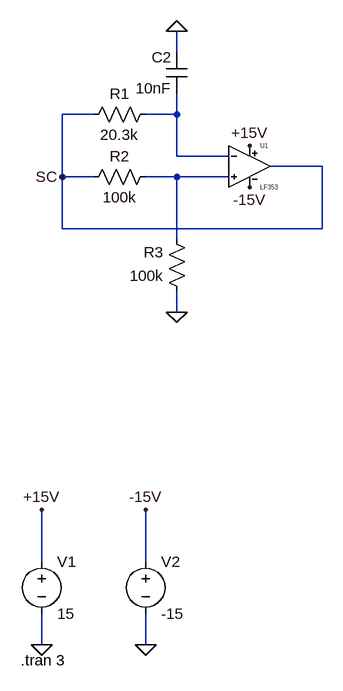
[diagram p0: schematic Draft1.asc]
Draft1.asc, the LTspice schematic file:
Version 4.1
SHEET 1 880 680
WIRE -64 -288 -64 -320
WIRE -192 -192 -240 -192
WIRE -64 -192 -64 -224
WIRE -64 -192 -112 -192
WIRE -64 -128 -64 -192
WIRE 16 -128 -64 -128
WIRE 160 -112 80 -112
WIRE -240 -96 -240 -192
WIRE -192 -96 -240 -96
WIRE -64 -96 -112 -96
WIRE 16 -96 -64 -96
WIRE -240 -16 -240 -96
WIRE 160 -16 160 -112
WIRE 160 -16 -240 -16
WIRE -64 0 -64 -96
WIRE -64 112 -64 80
WIRE -272 496 -272 416
WIRE -112 496 -112 416
WIRE -272 624 -272 576
WIRE -112 624 -112 576
FLAG -272 624 0
FLAG -112 624 0
FLAG -272 416 +15V
FLAG -112 416 -15V
FLAG 48 -144 +15V
FLAG 48 -80 -15V
FLAG -64 -320 0
FLAG -64 112 0
FLAG -240 -96 SC
SYMBOL voltage -272 480 R0
WINDOW 123 0 0 Left 0
WINDOW 39 0 0 Left 0
SYMATTR InstName V1
SYMATTR Value 15
SYMBOL voltage -112 480 R0
WINDOW 123 0 0 Left 0
WINDOW 39 0 0 Left 0
SYMATTR InstName V2
SYMATTR Value -15
SYMBOL UserLibs\\LTwiki\\lf353_ns 48 -176 R0
SYMATTR InstName U1
SYMBOL res -208 -176 R270
WINDOW 0 32 56 VTop 2
WINDOW 3 0 56 VBottom 2
SYMATTR InstName R1
SYMATTR Value 20.3k
SYMBOL res -96 -112 R90
WINDOW 0 0 56 VBottom 2
WINDOW 3 32 56 VTop 2
SYMATTR InstName R2
SYMATTR Value 100k
SYMBOL res -48 96 R180
WINDOW 0 36 76 Left 2
WINDOW 3 36 40 Left 2
SYMATTR InstName R3
SYMATTR Value 100k
SYMBOL cap -48 -224 R180
WINDOW 0 24 56 Left 2
WINDOW 3 24 8 Left 2
SYMATTR InstName C2
SYMATTR Value 10nF
TEXT -304 648 Left 2 !.tran 3

The netlist it stands for:
* Draft1.asc
V1 +15V 0 15
V2 -15V 0 -15
X§U1 N002 N001 +15V -15V SC LF353/NS  ; pins In+ In- V+ V- OUT
R1 SC N001 20.3k
R2 N002 SC 100k
R3 0 N002 100k
C2 N001 0 10nF
.tran 3
.lib LF353.mod
.backanno
.end